# Altium project Audio-Switcher-v1.1.PrjPcb (part 1 of 2)
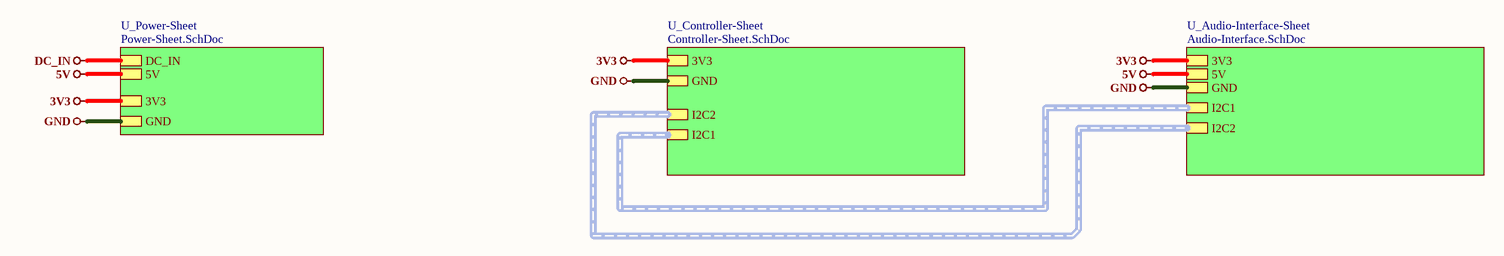
[diagram p0: Top_Sheet.SchDoc]
4 sheets, 134 parts. Net scope: hierarchical (ports join the sheet entries above them; power ports are global).
Board file: Audio-Switcher-v1.1.PcbDoc
Sheets:
  Top_Sheet.SchDoc
    U_Controller-Sheet = Controller-Sheet.SchDoc
    U_Power-Sheet = Power-Sheet.SchDoc
    U_Audio-Interface-Sheet = Audio-Interface.SchDoc

## Sheet Top_Sheet.SchDoc
size 420 x 297 mm; SheetNumber: 1; SheetTotal: 4

### Sub-sheets
U_Audio-Interface-Sheet = Audio-Interface.SchDoc: I2C1 (harness I2C), 3V3, GND, 5V, I2C2 (harness I2C)
U_Controller-Sheet = Controller-Sheet.SchDoc: 3V3, GND, I2C1 (harness I2C), I2C2 (harness I2C)
U_Power-Sheet = Power-Sheet.SchDoc: 3V3, 5V, GND, DC_IN

### Nets
3V3: sheet U_Controller-Sheet/3V3, sheet U_Power-Sheet/3V3, sheet U_Audio-Interface-Sheet/3V3
5V: sheet U_Power-Sheet/5V, sheet U_Audio-Interface-Sheet/5V
GND: sheet U_Controller-Sheet/GND, sheet U_Power-Sheet/GND, sheet U_Audio-Interface-Sheet/GND

### Buses and harness runs
harness sheet U_Audio-Interface-Sheet/I2C1 = sheet U_Controller-Sheet/I2C1
harness sheet U_Audio-Interface-Sheet/I2C2 = sheet U_Controller-Sheet/I2C2

### Notes on the sheet
- File:
- Title:
- Date:
- Page
- Num:
- Total:
- Drawn By: Huzaifa Ali

## Sheet Controller-Sheet.SchDoc
size 420 x 297 mm; SheetNumber: 3; SheetTotal: 4
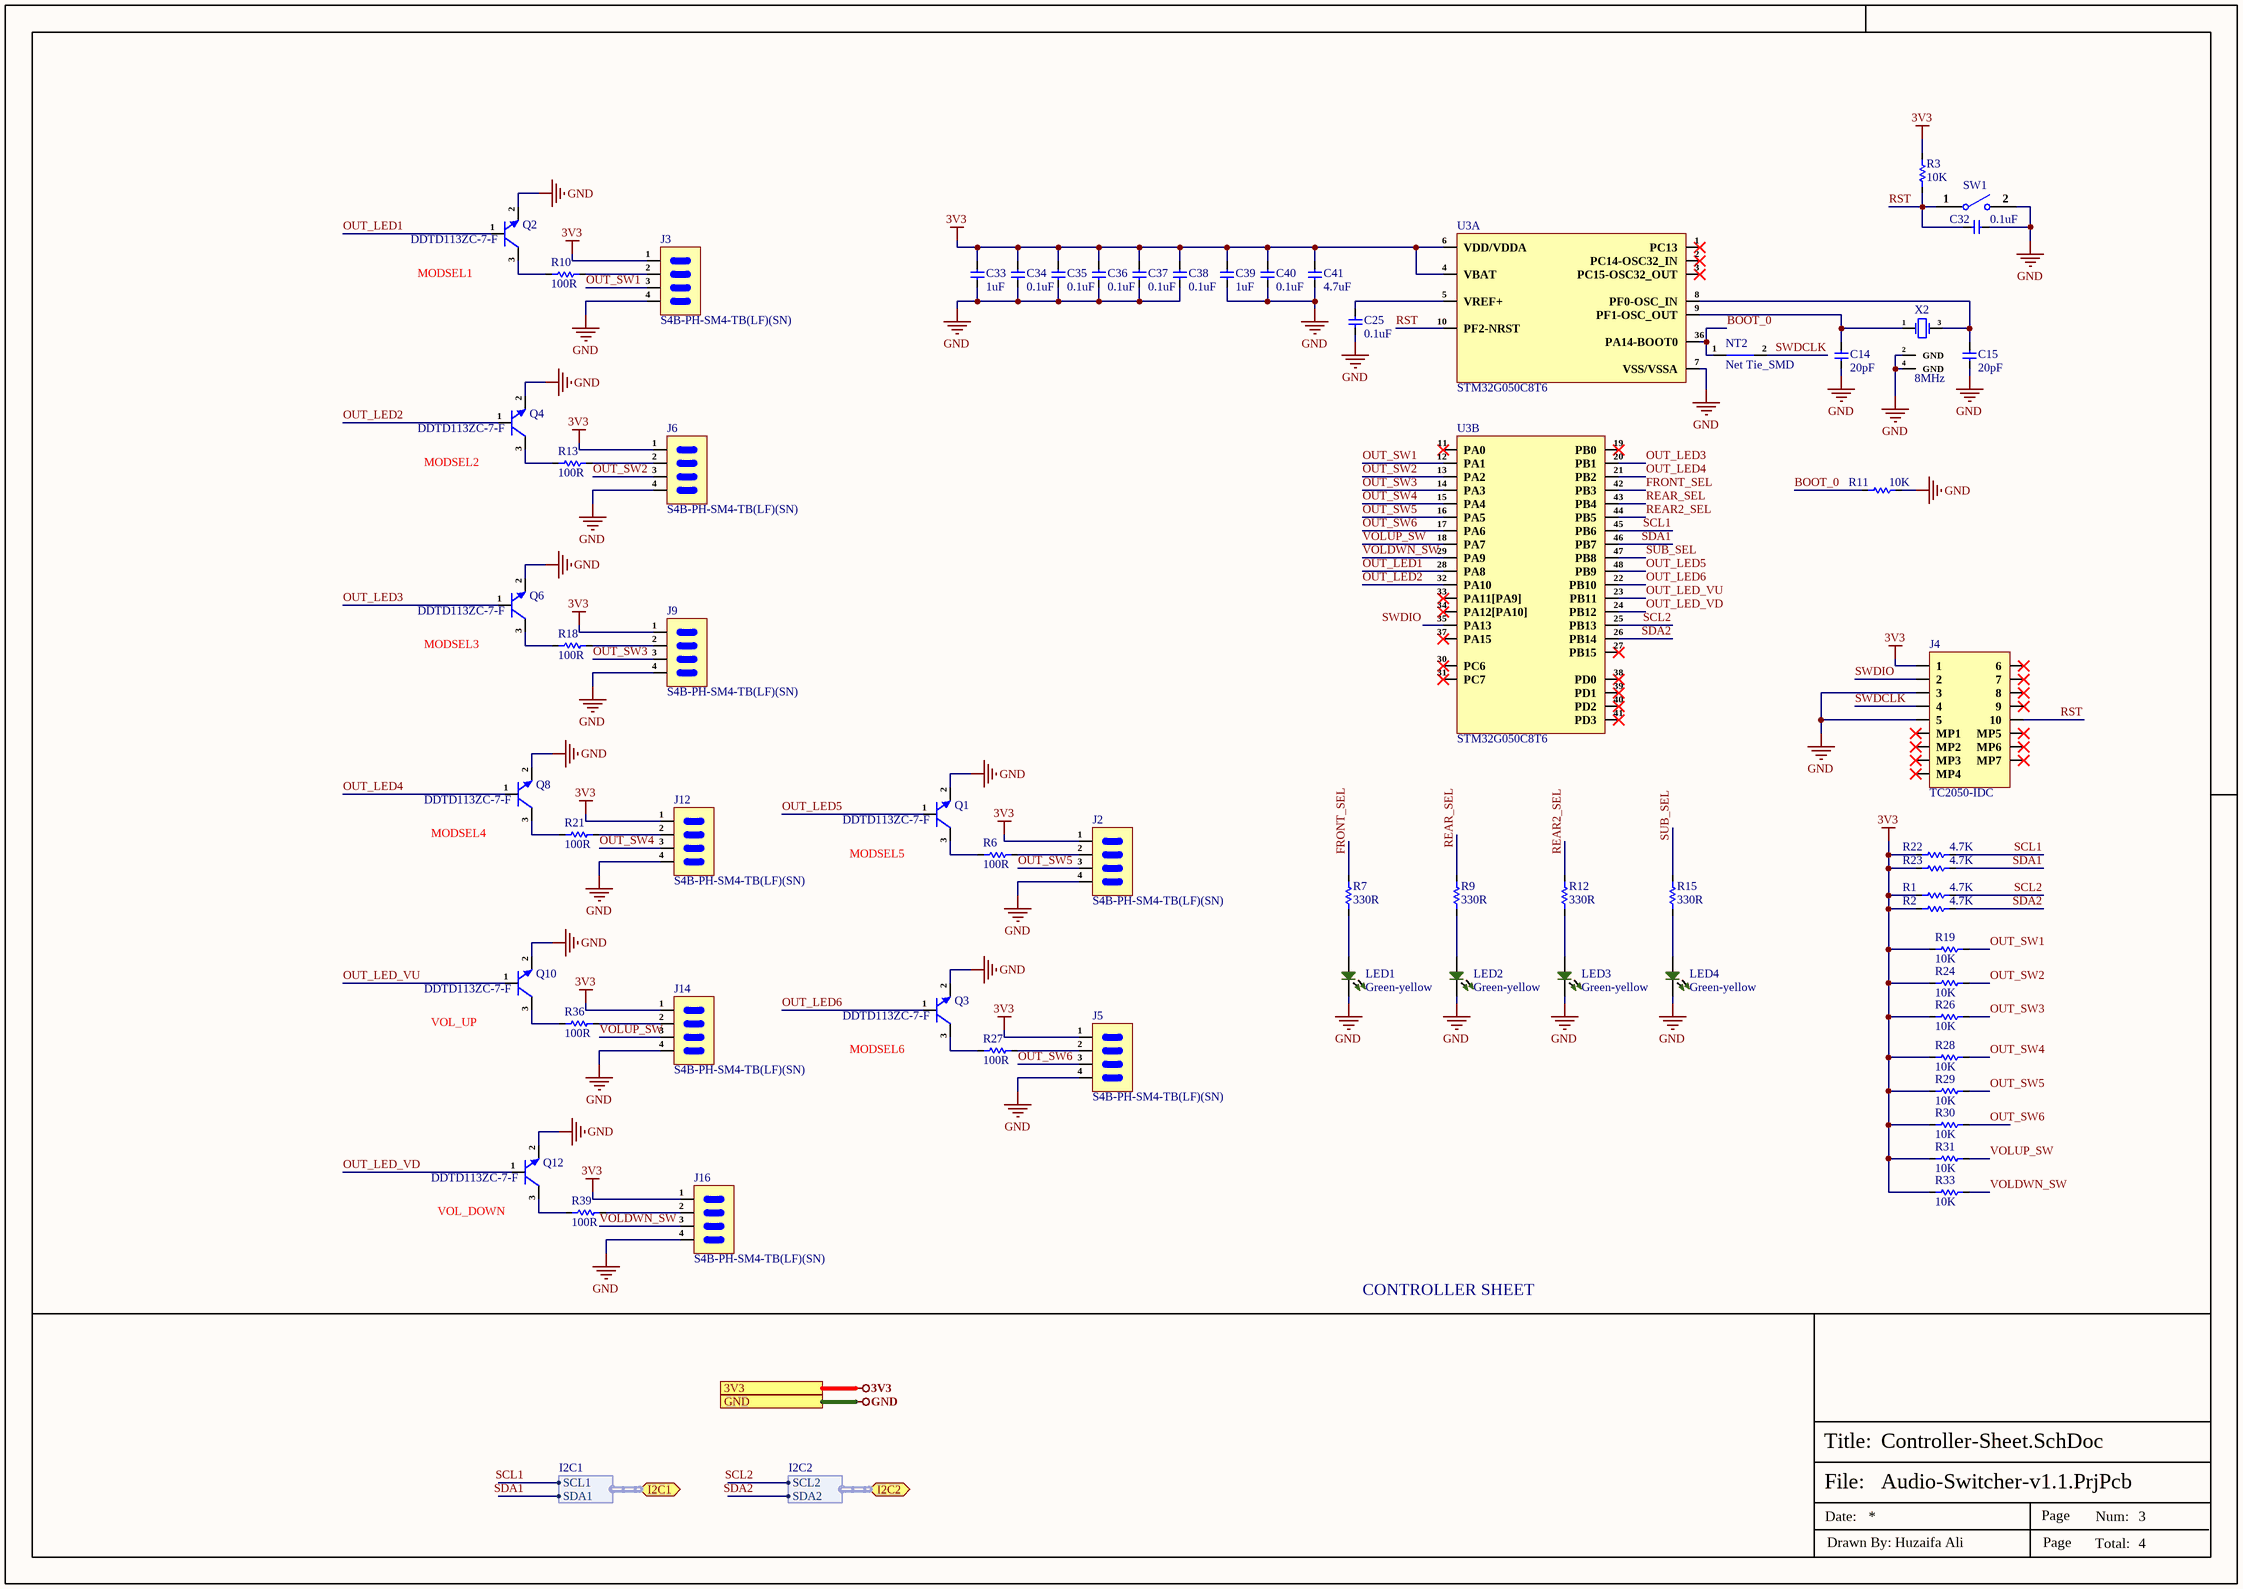
[diagram p1: Controller-Sheet.SchDoc]

### Parts
C14  20pF  [Cap-0402]
C15  20pF  [Cap-0402]
C25  0.1uF  [Cap-0402]
C32  0.1uF  [Cap-0402]
C33  1uF  [Cap-0402]
C34  0.1uF  [Cap-0402]
C35  0.1uF  [Cap-0402]
C36  0.1uF  [Cap-0402]
C37  0.1uF  [Cap-0402]
C38  0.1uF  [Cap-0402]
C39  1uF  [Cap-0402]
C40  0.1uF  [Cap-0402]
C41  4.7uF  [Cap-0402]
J2  S4B-PH-SM4-TB(LF)(SN)  [S4B-PH-SM4-TB(LF)(SN)]
J3  S4B-PH-SM4-TB(LF)(SN)  [S4B-PH-SM4-TB(LF)(SN)]
J4  TC2050-IDC  [TC2050-IDC_]
J5  S4B-PH-SM4-TB(LF)(SN)  [S4B-PH-SM4-TB(LF)(SN)]
J6  S4B-PH-SM4-TB(LF)(SN)  [S4B-PH-SM4-TB(LF)(SN)]
J9  S4B-PH-SM4-TB(LF)(SN)  [S4B-PH-SM4-TB(LF)(SN)]
J12  S4B-PH-SM4-TB(LF)(SN)  [S4B-PH-SM4-TB(LF)(SN)]
J14  S4B-PH-SM4-TB(LF)(SN)  [S4B-PH-SM4-TB(LF)(SN)]
J16  S4B-PH-SM4-TB(LF)(SN)  [S4B-PH-SM4-TB(LF)(SN)]
LED1  Green-yellow  [TH LED Green 3MM]
LED2  Green-yellow  [TH LED Green 3MM]
LED3  Green-yellow  [TH LED Green 3MM]
LED4  Green-yellow  [TH LED Green 3MM]
NT2  Net Tie_SMD  [Net Tie Pad]  (net tie, no BOM)
Q1  DDTD113ZC-7-F  [SOT-23]
Q2  DDTD113ZC-7-F  [SOT-23]
Q3  DDTD113ZC-7-F  [SOT-23]
Q4  DDTD113ZC-7-F  [SOT-23]
Q6  DDTD113ZC-7-F  [SOT-23]
Q8  DDTD113ZC-7-F  [SOT-23]
Q10  DDTD113ZC-7-F  [SOT-23]
Q12  DDTD113ZC-7-F  [SOT-23]
R1  4.7K  [Res-0402]
R2  4.7K  [Res-0402]
R3  10K  [Res-0402]
R6  100R  [Res-0603]
R7  330R  [Res-0201]
R9  330R  [Res-0201]
R10  100R  [Res-0603]
R11  10K  [Res-0402]
R12  330R  [Res-0201]
R13  100R  [Res-0603]
R15  330R  [Res-0201]
R18  100R  [Res-0603]
R19  10K  [Res-0402]
R21  100R  [Res-0603]
R22  4.7K  [Res-0402]
R23  4.7K  [Res-0402]
R24  10K  [Res-0402]
R26  10K  [Res-0402]
R27  100R  [Res-0603]
R28  10K  [Res-0402]
R29  10K  [Res-0402]
R30  10K  [Res-0402]
R31  10K  [Res-0402]
R33  10K  [Res-0402]
R36  100R  [Res-0603]
R39  100R  [Res-0603]
SW1  B3U-1000P  [B3U-1000P]  (value not drawn)
U3  STM32G050C8T6  [48-LQFP (7x7)_]  (parts A,B of 2)
X2  8MHz  [5TJ480000XYLBC_]

### Ports
3V3 (see Top_Sheet[3A], Audio-Interface[5D], Power-Sheet[4D]), GND (see Top_Sheet[3B], Audio-Interface[5D], Power-Sheet[4D]), I2C1 (bidir, harness I2C1, see Top_Sheet[3B], Audio-Interface[2D]), I2C2 (bidir, harness I2C2, see Top_Sheet[3B], Audio-Interface[2D])

### Harnesses
I2C1: SCL1, SDA1
I2C2: SCL2, SDA2

### Nets
3V3: C33.2 C34.2 C35.2 C36.2 C37.2 C38.2 C39.2 C40.2 C41.2 J2.1 J3.1 J4.1 J5.1 J6.1 J9.1 J12.1 J14.1 J16.1 R1.1 R2.1 R3.1 R19.1 R22.1 R23.1 R24.1 R26.1 R28.1 R29.1 R30.1 R31.1 R33.1 U3.4(VBAT) U3.6(VDD/VDDA) ; port 3V3
GND: C14.1 C15.1 C25.1 C32.1 C33.1 C34.1 C35.1 C36.1 C37.1 C38.1 C39.1 C40.1 C41.1 J2.4 J3.4 J4.3 J4.5 J5.4 J6.4 J9.4 J12.4 J14.4 J16.4 LED1.2 LED2.2 LED3.2 LED4.2 Q1.2(E) Q2.2(E) Q3.2(E) Q4.2(E) Q6.2(E) Q8.2(E) Q10.2(E) Q12.2(E) R11.1 SW1.2 U3.7(VSS/VSSA) X2.2(GND) X2.4(GND) ; port GND
BOOT_0: NT2.1 R11.2 U3.36(PA14-BOOT0)
FRONT_SEL: R7.2 U3.42(PB3)
OUT_LED1: Q2.1(B) U3.28(PA8)
OUT_LED2: Q4.1(B) U3.32(PA10)
OUT_LED3: Q6.1(B) U3.20(PB1)
OUT_LED4: Q8.1(B) U3.21(PB2)
OUT_LED5: Q1.1(B) U3.48(PB9)
OUT_LED6: Q3.1(B) U3.22(PB10)
OUT_LED_VD: Q12.1(B) U3.24(PB12)
OUT_LED_VU: Q10.1(B) U3.23(PB11)
OUT_SW1: J3.3 R19.2 U3.12(PA1)
OUT_SW2: J6.3 R24.2 U3.13(PA2)
OUT_SW3: J9.3 R26.2 U3.14(PA3)
OUT_SW4: J12.3 R28.2 U3.15(PA4)
OUT_SW5: J2.3 R29.2 U3.16(PA5)
OUT_SW6: J5.3 R30.2 U3.17(PA6)
REAR2_SEL: R12.2 U3.44(PB5)
REAR_SEL: R9.2 U3.43(PB4)
RST: C32.2 J4.10 R3.2 SW1.1 U3.10(PF2-NRST)
SCL1: R22.2 U3.45(PB6) ; port I2C1.SCL1
SCL2: R1.2 U3.25(PB13) ; port I2C2.SCL2
SDA1: R23.2 U3.46(PB7) ; port I2C1.SDA1
SDA2: R2.2 U3.26(PB14) ; port I2C2.SDA2
SUB_SEL: R15.2 U3.47(PB8)
SWDCLK: J4.4 NT2.2
SWDIO: J4.2 U3.35(PA13)
VOLDWN_SW: J16.3 R33.2 U3.29(PA9)
VOLUP_SW: J14.3 R31.2 U3.18(PA7)
NetC14_2: C14.2 U3.9(PF1-OSC_OUT) X2.1(OSC1)
NetC15_2: C15.2 U3.8(PF0-OSC_IN) X2.3(OSC2)
NetC25_2: C25.2 U3.5(VREF+)
NetJ2_2: J2.2 R6.2
NetJ3_2: J3.2 R10.2
NetJ5_2: J5.2 R27.2
NetJ6_2: J6.2 R13.2
NetJ9_2: J9.2 R18.2
NetJ12_2: J12.2 R21.2
NetJ14_2: J14.2 R36.2
NetJ16_2: J16.2 R39.2
NetLED1_1: LED1.1 R7.1
NetLED2_1: LED2.1 R9.1
NetLED3_1: LED3.1 R12.1
NetLED4_1: LED4.1 R15.1
NetQ1_3: Q1.3(C) R6.1
NetQ2_3: Q2.3(C) R10.1
NetQ3_3: Q3.3(C) R27.1
NetQ4_3: Q4.3(C) R13.1
NetQ6_3: Q6.3(C) R18.1
NetQ8_3: Q8.3(C) R21.1
NetQ10_3: Q10.3(C) R36.1
NetQ12_3: Q12.3(C) R39.1

Not connected (* = marked no-connect by the designer): J4 6* 7* 8* 9* MP1* MP2* MP3* MP4* MP5* MP6* MP7*; U3 1(PC13)* 2(PC14-OSC32_IN)* 3(PC15-OSC32_OUT)* 11(PA0)* 19(PB0)* 27(PB15)* 30(PC6)* 31(PC7)* 33(PA11[PA9])* 34(PA12[PA10])* 37(PA15)* 38(PD0)* 39(PD1)* 40(PD2)* 41(PD3)*

### Notes on the sheet
- (near Q2) MODSEL1
- (near Q4) MODSEL2
- (near Q6) MODSEL3
- (near Q8) MODSEL4
- (near Q1) MODSEL5
- VOL_UP
- (near Q3) MODSEL6
- (near Q12) VOL_DOWN
- CONTROLLER SHEET
- File:
- Title:
- Date:
- Page
- Num:
- Total:
- Drawn By: Huzaifa Ali

### Library data of the parts
C14 C15 = CC0402JRNPO9BN200: CAP CER 20PF 50V C0G/NPO 0402; Manufacturer: Yageo; Item Type: Capacitor; Temperature Coefficient: 30ppm/°C; Supplier: Avnet; LCSC Part Number: C107000; Manufacturer Part Number: CC0402JRNPO9BN200; RoHS: Yes; Stock: 20000; Pricing: 10000=0.00221 (USD); Halogen Free: 5694HalogenFree; ComponentLink1URL: https://datasheet.ciiva.com/176/mlccorderingcode-176360.pdf?src-supplier=Digikey; ComponentLink1Description: https://datasheet.ciiva.com/176/mlccorderingcode-176360.pdf?src-supplier=Digikey; ComponentLink2URL: https://datasheet.ciiva.com/176/mlccorderingcode-176361.pdf?src-supplier=Digikey; ComponentLink2Description: https://datasheet.ciiva.com/176/mlccorderingcode-176361.pdf?src-supplier=Digikey; ComponentLink3URL: https://datasheet.ciiva.com/176/mlccorderingcode-176362.pdf?src-supplier=Digikey; ComponentLink3Description: https://datasheet.ciiva.com/176/mlccorderingcode-176362.pdf?src-supplier=Digikey; ComponentLink4URL: https://datasheet.ciiva.com/7656/1132289-7656614.pdf?src-supplier=Element14; ComponentLink4Description: https://datasheet.ciiva.com/7656/1132289-7656614.pdf?src-supplier=Element14; ComponentLink5URL: https://datasheet.ciiva.com/5427/upy-gp-np0-16v-to-50v-8-3714-5427769.pdf?src-supplier=Mouser; ComponentLink5Description: https://datasheet.ciiva.com/5427/upy-gp-np0-16v-to-50v-8-3714-5427769.pdf?src-supplier=Mouser
C25 C32 C34-C38 C40 = CC0402KRX7R8BB104: CAP CER 0.1UF 25V X7R 0402; Manufacturer: Yageo; Tolerance: 10%; Capacitance: 100nF; Dissipation Factor: 3.5%; Supplier 1: Digi-Key; Manufacturer Part Number: CC0402KRX7R8BB104; RoHS: Yes; Category: Ceramic Capacitors; Stock 1: 1841009; Pricing 1: 1=0.10000, 10=0.03100, 50=0.01700, 100=0.01390, 500=0.00990, 1000=0.00777, 2500=0.00707, 5000=0.00650 (USD); Mount: Surface Mount; Case/Package: 0402; Case Code (Imperial): 0402; Case Code (Metric): 1005; Min Operating Temperature: -55°C; Max Operating Temperature: 125°C; Dielectric: X7R; Voltage Rating: 25V; Voltage Rating (DC): 25V; Packaging: Tape and Reel; Termination: SMD/SMT; Resistor Type: Ceramic; Length: 1mm; Width: 0.02inch; Height: 0.5mm; Thickness: 0.022inch; Depth: 0.5mm; Radiation Hardening: No; Lead Free: Lead Free; Halogen Free: Halogen Free; ComponentLink1URL: https://datasheet.ciiva.com/11464/upy-gphc-x7r-6-3v-to-50v-8-11464889.pdf?src-supplier=Avnet; ComponentLink1Description: https://datasheet.ciiva.com/11464/upy-gphc-x7r-6-3v-to-50v-8-11464889.pdf?src-supplier=Avnet; ComponentLink2URL: https://datasheet.ciiva.com/13210/upy-gphc-x7r-6-3v-to-50v-8-12304-13210908.pdf?src-supplier=Mouser; ComponentLink2Description: https://datasheet.ciiva.com/13210/upy-gphc-x7r-6-3v-to-50v-8-12304-13210908.pdf?src-supplier=Mouser; ComponentLink3URL: https://datasheet.ciiva.com/17437/upy-gphc-x7r-6-3v-to-50v-8-17437357.pdf?src-supplier=Avnet+Europe; ComponentLink3Description: https://datasheet.ciiva.com/17437/upy-gphc-x7r-6-3v-to-50v-8-17437357.pdf?src-supplier=Avnet+Europe; Supplier Part Number 1: 311-2077-1-ND; LCSC Part Number: C105883
C33 C39 = CC0402KRX5R7BB105: CAP CER 1UF 16V X5R 0402; Manufacturer: Yageo; Tolerance: 10%; Item Type: Capacitor; Supplier 1: Digi-Key; Manufacturer Part Number: CC0402KRX5R7BB105; Stock 1: 1405667; Pricing 1: 1=0.36, 10=0.252, 100=0.1512, 500=0.1134, 1000=0.09576, 2500=0.09072, 5000=0.08568 (USD); Mount: Surface Mount; Case/Package: 0402; Weight: 2.3E-05oz; Case Code (Imperial): 0402; Case Code (Metric): 1005; Min Operating Temperature: -55°C; Max Operating Temperature: 85°C; Capacitance: 1uF; Dielectric: X5R; Packaging: Tape and Reel; Voltage Rating (DC): 16V; Voltage Rating: 16V; Termination: SMD/SMT; Composition: Ceramic; Length: 1mm; Height: 0.5mm; Width: 0.02inch; Thickness: 0.022inch; Depth: 0.5mm; Radiation Hardening: No; Lead Free: Lead Free; Halogen Free: Halogen Free; ComponentLink1URL: http://www.yageo.com/documents/recent/UPY-GPHC_X5R_4V-to-50V_12.pdf?src-supplier=Avnet+Europe; ComponentLink1Description: http://www.yageo.com/documents/recent/UPY-GPHC_X5R_4V-to-50V_12.pdf?src-supplier=Avnet+Europe; Supplier Part Number 1: 311-1691-6-ND; LCSC Part Number: C325464
C41 = CL05A475MO5NUNC: CAP CER 4.7UF 16V X5R 0402; Manufacturer: Samsung; Material: 4241ConductorMaterial; Tolerance: 20%; Supplier 1: Avnet; Manufacturer Part Number: CL05A475MO5NUNC; RoHS: Yes; Category: Ceramic Capacitors; Stock 1: 50000; Pricing 1: 10000=0.09712 (USD); Mount: Surface Mount; Case/Package: 0402; Case Code (Metric): 1005; Case Code (Imperial): 0402; Min Operating Temperature: -55°C; Max Operating Temperature: 85°C; Packaging: Cut Tape; Capacitance: 4.7uF; Voltage Rating: 16V; Series: CL; Voltage Rating (DC): 16V; Length: 0.039inch; Width: 0.02inch; Height: 550um; Thickness: 0.022inch; RoHS Compliant: Yes; ComponentLink1URL: http://www.farnell.com/datasheets/2710653.pdf?src-supplier=Farnell; ComponentLink1Description: http://www.farnell.com/datasheets/2710653.pdf?src-supplier=Farnell; ComponentLink2URL: http://www.samsungsem.com/kr/support/product-search/mlcc/CL05A475MO5NUNC.jsp?src-supplier=Digikey; ComponentLink2Description: http://www.samsungsem.com/kr/support/product-search/mlcc/CL05A475MO5NUNC.jsp?src-supplier=Digikey; ComponentLink3URL: http://www.farnell.com/datasheets/2710653.pdf?src-supplier=Element14; ComponentLink3Description: http://www.farnell.com/datasheets/2710653.pdf?src-supplier=Element14; ComponentLink4URL: https://datasheet.octopart.com/CL05A475MO5NUNC-Samsung-Electro-Mechanics-datasheet-123102911.pdf?src-supplier=Future+Electronics; ComponentLink4Description: https://datasheet.octopart.com/CL05A475MO5NUNC-Samsung-Electro-Mechanics-datasheet-123102911.pdf?src-supplier=Future+Electronics; ComponentLink5URL: http://www.farnell.com/datasheets/2710653.pdf?src-supplier=Newark; ComponentLink5Description: http://www.farnell.com/datasheets/2710653.pdf?src-supplier=Newark; Supplier Part Number 1: CL05A475MO5NUNC
J2 J3 J5 J6 J9 J12 J14 J16 = S4B-PH-SM4-TB(LF)(SN): CONN HEADER SMD R/A 4POS 2MM; Manufacturer: JST; Item Type: Connectors; Gender: 29Gender; Supplier: Future Electronics; Supplier Part Number: 7687031; Manufacturer Part Number: S4B-PH-SM4-TB(LF)(SN); RoHS: Yes; Stock: 78; Pricing: 1=0.935, 10=0.83, 40=0.77, 150=0.71, 500=0.655 (USD); ComponentLink1URL: https://datasheet.ciiva.com/11746/0900766b80df0d9d-11746552.pdf?src-supplier=Rs; ComponentLink1Description: https://datasheet.ciiva.com/11746/0900766b80df0d9d-11746552.pdf?src-supplier=Rs; ComponentLink2URL: https://datasheet.ciiva.com/712/eph-712578.pdf?src-supplier=Digikey; ComponentLink2Description: https://datasheet.ciiva.com/712/eph-712578.pdf?src-supplier=Digikey; ComponentLink3URL: https://datasheet.ciiva.com/712/eph-712579.pdf?src-supplier=Digikey; ComponentLink3Description: https://datasheet.ciiva.com/712/eph-712579.pdf?src-supplier=Digikey; ComponentLink4URL: https://datasheet.ciiva.com/730/eph-730675.pdf?src-supplier=Digikey; ComponentLink4Description: https://datasheet.ciiva.com/730/eph-730675.pdf?src-supplier=Digikey; ComponentLink5URL: https://datasheet.ciiva.com/8052/1699381-8052234.pdf?src-supplier=Element14; ComponentLink5Description: https://datasheet.ciiva.com/8052/1699381-8052234.pdf?src-supplier=Element14; LCSC Part Number: C265102
J4 = TC2050-IDC: CBL PLUG-OF-NAILS 10-PIN W/LEGS; Manufacturer: Tag-Connect; Supplier 1: Digi-Key; Manufacturer Part Number: TC2050-IDC; Stock 1: 59; Pricing 1: 1=40.17 (USD); Package Quantity: 1; ComponentLink1URL: http://www.tag-connect.com/Materials/TC2050-IDC%20Datasheet.pdf?src-supplier=Digi-Key; ComponentLink1Description: http://www.tag-connect.com/Materials/TC2050-IDC%20Datasheet.pdf?src-supplier=Digi-Key; Supplier Part Number 1: TC2050-IDC-ND
LED1-LED4 = 204-10SYGD/S530-E3: LED Single Standard Yellow Green 573nm 25mA 2-Pin T-1 Bag; Manufacturer: Everlight; Viewing Angle: 45°; Luminous Intensity: 100mcd; Forward Voltage: 2.4V; Lens Style: Diffused,Colored; Power Dissipation: 60W; Number of Elements: 1; Reverse Voltage: 5V; Supplier: Digikey; Supplier Part Number: 1080-204-10SYGD/S530-E3TR-ND; Manufacturer Part Number: 204-10SYGD/S530-E3; RoHS: Yes; Pricing: 3000=0.10482, 5000=0.09847, 10000=0.09212, 25000=0.08449, 50000=0.08132, 100000=0.07941 (USD); Mounting Technology: Through Hole; Case/Package: T; Pins: 2; Min Operating Temperature: -40°C; Max Operating Temperature: 85°C; Forward Current: 25mA; Packaging: Tape and Reel; Dominant Wavelength: 573nm; Wavelength: 573nm; Length: 4mm; Depth: 4mm; Radiation Hardening: No; RoHS Compliant: Yes; ComponentLink1URL: https://datasheet.ciiva.com/26901/getdatasheetpartid-707371-26901329.pdf?src-supplier=Verical; ComponentLink1Description: https://datasheet.ciiva.com/26901/getdatasheetpartid-707371-26901329.pdf?src-supplier=Verical; LCSC Part Number: C85161; Item Type: LED
NT2 = Net Tie_SMD: Net Tie SMD; Manufacturer Part Number: Net Tie; Item Type: Net Tie Pad
Q1-Q4 Q6 Q8 Q10 Q12 = DDTD113ZC-7-F: TRANS PREBIAS NPN 50V SOT23-3; Manufacturer: Diodes Zetex; Item Type: BJTs; Supplier: Digikey; Supplier Part Number: DDTD113ZC-7FDICT-ND; Manufacturer Part Number: DDTD113ZC-7-F; RoHS: Yes; Stock: 793860; Pricing: 1=0.31, 10=0.21, 100=0.1027, 500=0.08562, 1000=0.05949 (USD); ComponentLink1URL: https://datasheet.ciiva.com/15139/getdatasheetpartid-323116-15139824.pdf?src-supplier=Verical; ComponentLink1Description: https://datasheet.ciiva.com/15139/getdatasheetpartid-323116-15139824.pdf?src-supplier=Verical
R1 R2 R22 R23 = RC0402FR-074K7L: RES 4.7K OHM 1% 1/16W 0402; Manufacturer: Yageo; Voltage Rating (DC): 50V; Power Rating: 62.5mW; Resistance: 4.7kR; Temperature Coefficient: 100ppm/°C; Max Power Dissipation: 63mW; Item Type: Resistor; Supplier 1: Avnet; Manufacturer Part Number: RC0402FR-074K7L; RoHS: Yes; Category: Chip SMD Resistors; Stock 1: 2420000; Pricing 1: 10000=0.00085 (USD); Case/Package: 0402; Number of Pins: 2; Case Code (Imperial): 0402; Case Code (Metric): 1005; Size Code: 0402; Min Operating Temperature: -55°C; Max Operating Temperature: 155°C; Tolerance: 1%; Voltage Rating: 50V; Packaging: Tape and Reel; Resistor Type: Thick Film; Termination: SMD/SMT; Features: Moisture Resistant; Series: RC; Number of Terminations: 2; Resistance Tolerance: 1%; Construction: Rectangular; Length: 1mm; Width: 0.5mm; Height: 0.32mm; Depth: 0.5mm; Height - Seated (Max): 0.016inch; RoHS Compliant: Yes; Reach SVHC Compliant: Yes; Military Standard: Not; Lead Free: Lead Free; ComponentLink1URL: https://datasheet.ciiva.com/22661/1686128-22661342.pdf?src-supplier=Element14; ComponentLink1Description: https://datasheet.ciiva.com/22661/1686128-22661342.pdf?src-supplier=Element14; ComponentLink2URL: https://datasheet.ciiva.com/7850/1018594-7850022.pdf?src-supplier=Element14; ComponentLink2Description: https://datasheet.ciiva.com/7850/1018594-7850022.pdf?src-supplier=Element14; ComponentLink3URL: https://datasheet.ciiva.com/7850/1018594-7850023.pdf?src-supplier=Element14; ComponentLink3Description: https://datasheet.ciiva.com/7850/1018594-7850023.pdf?src-supplier=Element14; ComponentLink4URL: https://datasheet.ciiva.com/15215/getdatasheetpartid-328119-15215035.pdf?src-supplier=Verical; ComponentLink4Description: https://datasheet.ciiva.com/15215/getdatasheetpartid-328119-15215035.pdf?src-supplier=Verical; Supplier Part Number 1: RC0402FR-074K7L; LCSC Part Number: C105871
R3 R11 R19 R24 R26 R28-R31 R33 = RC0402FR-0710KL: RES 10K OHM 1% 1/16W 0402; Manufacturer: Yageo; Resistance: 10kR; Voltage Rating (DC): 50V; Temperature Coefficient: 100ppm/°C; Power Rating: 62.5mW; Max Power Dissipation: 63mW; Item Type: Resistor; Supplier 1: Mouser; Manufacturer Part Number: RC0402FR-0710KL; RoHS: Yes; Category: Chip SMD Resistors; Stock 1: 18648329; Pricing 1: 1=0.10000, 10=0.01400, 50=0.01400, 100=0.00500, 1000=0.00300, 10000=0.00200 (USD); Case/Package: 0402; Number of Pins: 2; Case Code (Imperial): 0402; Case Code (Metric): 1005; Min Operating Temperature: -55°C; Max Operating Temperature: 155°C; Resistor Type: Thick Film; Tolerance: 1%; Packaging: Tape and Reel; Voltage Rating: 50V; Termination: SMD/SMT; Working Voltage: 50V; Number of Terminations: 2; Features: Moisture Resistant; Series: RC; Resistance Tolerance: 1%; Construction: Rectangular; Length: 1mm; Width: 0.5mm; Height: 0.32mm; Depth: 0.5mm; Lead Pitch: 0.2mm; REACH SVHC: No SVHC; Lead Free: Lead Free; RoHS Compliant: Yes; Military Standard: Not; ComponentLink1URL: https://datasheet.ciiva.com/7660/38568-7660787.pdf?src-supplier=Element14; ComponentLink1Description: https://datasheet.ciiva.com/7660/38568-7660787.pdf?src-supplier=Element14; ComponentLink2URL: https://datasheet.ciiva.com/7849/1686128-7849814.pdf?src-supplier=Element14; ComponentLink2Description: https://datasheet.ciiva.com/7849/1686128-7849814.pdf?src-supplier=Element14; ComponentLink3URL: https://datasheet.ciiva.com/7983/1018594-7983486.pdf?src-supplier=Element14; ComponentLink3Description: https://datasheet.ciiva.com/7983/1018594-7983486.pdf?src-supplier=Element14; ComponentLink4URL: https://datasheet.ciiva.com/22747/1018594-22747512.pdf?src-supplier=Element14; ComponentLink4Description: https://datasheet.ciiva.com/22747/1018594-22747512.pdf?src-supplier=Element14; ComponentLink5URL: https://datasheet.ciiva.com/12667/pyu-rc0402-51-rohs-l-6-r-12667067.pdf?src-supplier=Mouser; ComponentLink5Description: https://datasheet.ciiva.com/12667/pyu-rc0402-51-rohs-l-6-r-12667067.pdf?src-supplier=Mouser; ComponentLink6URL: https://datasheet.ciiva.com/7849/1784430-7849813.pdf?src-supplier=Element14; ComponentLink6Description: https://datasheet.ciiva.com/7849/1784430-7849813.pdf?src-supplier=Element14; ComponentLink7URL: https://datasheet.ciiva.com/7849/1784430-7849815.pdf?src-supplier=Element14; ComponentLink7Description: https://datasheet.ciiva.com/7849/1784430-7849815.pdf?src-supplier=Element14; Supplier Part Number 1: 603-RC0402FR-0710KL; LCSC Part Number: C60490
R6 R10 R13 R18 R21 R27 R36 R39 = RC0603FR-07100RL: RES SMD 100 OHM 1% 1/10W 0603; Manufacturer: Yageo; Temperature Coefficient: 100ppm/°C; Voltage Rating (DC): 50V; Power Rating: 100mW; Item Type: Resistor; Supplier 1: Arrow Electronics; Manufacturer Part Number: RC0603FR-07100RL; RoHS: Yes; Category: Chip SMD Resistors; Stock 1: 3800000; Pricing 1: 5000=0.00300, 5000=0.00200, 5000=0.00450, 50000=0.00410, 500000=0.00230, 2500000=0.00140 (USD); Case/Package: 0603; Number of Pins: 2; Case Code (Imperial): 0603; Case Code (Metric): 1608; Size Code: 0603; Min Operating Temperature: -55°C; Max Operating Temperature: 155°C; Resistance: 100R; Tolerance: 1%; Resistor Type: Thick Film; Packaging: Tape and Reel; Voltage Rating: 50V; Termination: SMD/SMT; Features: Moisture Resistant; Series: RC; Max Power Dissipation: 100mW; Number of Terminations: 2; Construction: Rectangular; Resistance Tolerance: 1%; Technology: THICK FILM; Length: 1.6mm; Width: 0.8mm; Height: 0.45mm; Depth: 0.8mm; REACH SVHC: Unknown; Lead Free: Lead Free; RoHS Compliant: Yes; Military Standard: Not; Supplier Part Number 1: RC0603FR-07100RL; LCSC Part Number: C105588
R7 R9 R12 R15 = RC0201DR-07330RL: RES 330 OHM 0.5% 1/20W 0201; Manufacturer: Yageo; Max Power Dissipation: 50mW; Temperature Coefficient: 200ppm/°C; Item Type: Resistor; Supplier 1: Digi-Key; Manufacturer Part Number: RC0201DR-07330RL; RoHS: Yes; Category: Chip SMD Resistors; Pricing 1: 10000=0.02267 (USD); Case/Package: 0201; Min Operating Temperature: -55°C; Max Operating Temperature: 125°C; Packaging: Tape and Reel; Value: 330R; Number of Terminations: 2; Tolerance: 0.5%; Features: Moisture Resistant; Series: RC; Length: 0.024inch; Width: 0.012inch; Height: 0.01inch; RoHS Compliant: Yes; ComponentLink1URL: http://www.yageo.com.tw/exep/pages/download/literatures/PYu-R_INT-thick_7.pdf?src-supplier=Digi-Key; ComponentLink1Description: http://www.yageo.com.tw/exep/pages/download/literatures/PYu-R_INT-thick_7.pdf?src-supplier=Digi-Key; Supplier Part Number 1: RC0201DR-07330RL-ND; LCSC Part Number: C851717
SW1 = B3U-1000P: SWITCH TACTILE SPST-NO 0.05A 12V; Manufacturer: Omron; Mechanical Life: 200000Cycles; Operating Force: 1.5N; Throw Configuration: SPST; Current Rating: 50mA; Contact Resistance: 100mR; Illumination Type: Non-Illuminated,Illuminated; Switch Travel: 0.15mm; Switch Function: Off-Mom; Actuator Type: Standard; Actuator Length: 0.4mm; Ratings: Dust Proof,IP40; ComponentLink1URL: http://www.farnell.com/datasheets/60838.pdf?src-supplier=Farnell; ComponentLink1Description: http://www.farnell.com/datasheets/60838.pdf?src-supplier=Farnell; ComponentLink2URL: http://www.farnell.com/datasheets/60838.pdf?src-supplier=Element14; ComponentLink2Description: http://www.farnell.com/datasheets/60838.pdf?src-supplier=Element14; ComponentLink3URL: https://omronfs.omron.com/en_US/ecb/products/pdf/en-b3u.pdf?src-supplier=Digi-Key; ComponentLink3Description: https://omronfs.omron.com/en_US/ecb/products/pdf/en-b3u.pdf?src-supplier=Digi-Key; ComponentLink4URL: http://www.omron.com/ecb/products/pdf/en-b3u.pdf?src-supplier=Digi-Key; ComponentLink4Description: http://www.omron.com/ecb/products/pdf/en-b3u.pdf?src-supplier=Digi-Key; ComponentLink5URL: https://www.distrelec.biz/Web/Downloads/he/et/B3U_eng_datasheet.pdf?mime=application%2Fpdf&src-supplier=Distrelec; ComponentLink5Description: https://www.distrelec.biz/Web/Downloads/he/et/B3U_eng_datasheet.pdf?mime=application%2Fpdf&src-supplier=Distrelec; ComponentLink6URL: http://www.onlinecomponents.com/productFiles/mf-OM/en-b3u.pdf?src-supplier=Onlinecomponents.com; ComponentLink6Description: http://www.onlinecomponents.com/productFiles/mf-OM/en-b3u.pdf?src-supplier=Onlinecomponents.com; Supplier 1: Digi-Key; Manufacturer Part Number: B3U-1000P; Stock 1: 116454; Pricing 1: 1=1, 10=0.961, 25=0.9064, 50=0.7976, 100=0.7251, 250=0.68888, 500=0.67074, 1000=0.52571 (USD); Mount: Surface Mount; Weight: 0.000776oz; Contact Material: Silver; Min Operating Temperature: -25°C; Max Operating Temperature: 70°C; Packaging: Tape and Reel; Voltage Rating (DC): 12V; Package Quantity: 1; Max Current Rating: 50mA; Termination: SMD/SMT; Orientation: Straight; Max Voltage Rating (DC): 12V; Electrical Life: 200000Cycles; Insulation Resistance: 100MR; Contact Current Rating: 50mA; Length: 4mm; Height: 1.2mm; Depth: 2.5mm; Width: 3mm; REACH SVHC: Unknown; Lead Free: Lead Free; ComponentLink7URL: https://www.verical.com/server-webapp/html/getDatasheet?partID=552554&src-supplier=Verical; ComponentLink7Description: https://www.verical.com/server-webapp/html/getDatasheet?partID=552554&src-supplier=Verical; ComponentLink8URL: http://www.farnell.com/datasheets/1685550.pdf?src-supplier=Element14; ComponentLink8Description: http://www.farnell.com/datasheets/1685550.pdf?src-supplier=Element14; ComponentLink9URL: http://www.farnell.com/datasheets/2610940.pdf?src-supplier=Farnell; ComponentLink9Description: http://www.farnell.com/datasheets/2610940.pdf?src-supplier=Farnell; ComponentLink10URL: https://www.alliedelec.com/m/d/4c8a9ef82804fc3c241a13c1e298fd73.pdf?src-supplier=Allied+Electronics; ComponentLink10Description: https://www.alliedelec.com/m/d/4c8a9ef82804fc3c241a13c1e298fd73.pdf?src-supplier=Allied+Electronics; Supplier Part Number 1: SW1020DKR-ND; LCSC Part Number: C231329; Item Type: Switch
U3 = STM32G050C8T6: IC MCU 32BIT 64KB FLASH 48LQFP; Manufacturer: STMicroelectronics; Supplier: Mouser; LCSC Part Number: C3227086; Manufacturer Part Number: STM32G050C8T6; RoHS: Yes; Item Type: IC; Stock: 2733; Pricing: 1=2.3, 10=1.75, 50=1.75, 100=1.67, 1000=1.12, 10000=1.04 (USD)
X2 = 5TJ480000XYLBC: 8MHz 18pF ±10ppm SMD5032-4P Crystals ROHS; Manufacturer: JYJE; Manufacturer Part Number: 5TJ480000XYLBC; ComponentLink1Description: LCSC; ComponentLink1URL: https://www.lcsc.com/product-detail/Crystals_JYJE-5TJ480000XYLBC_C2149247.html; Package: SMD5032-4P; LCSC Part Number: C2149247; Item Type: Crystal

## Sheet Power-Sheet.SchDoc
size 420 x 297 mm; SheetNumber: 2; SheetTotal: 4
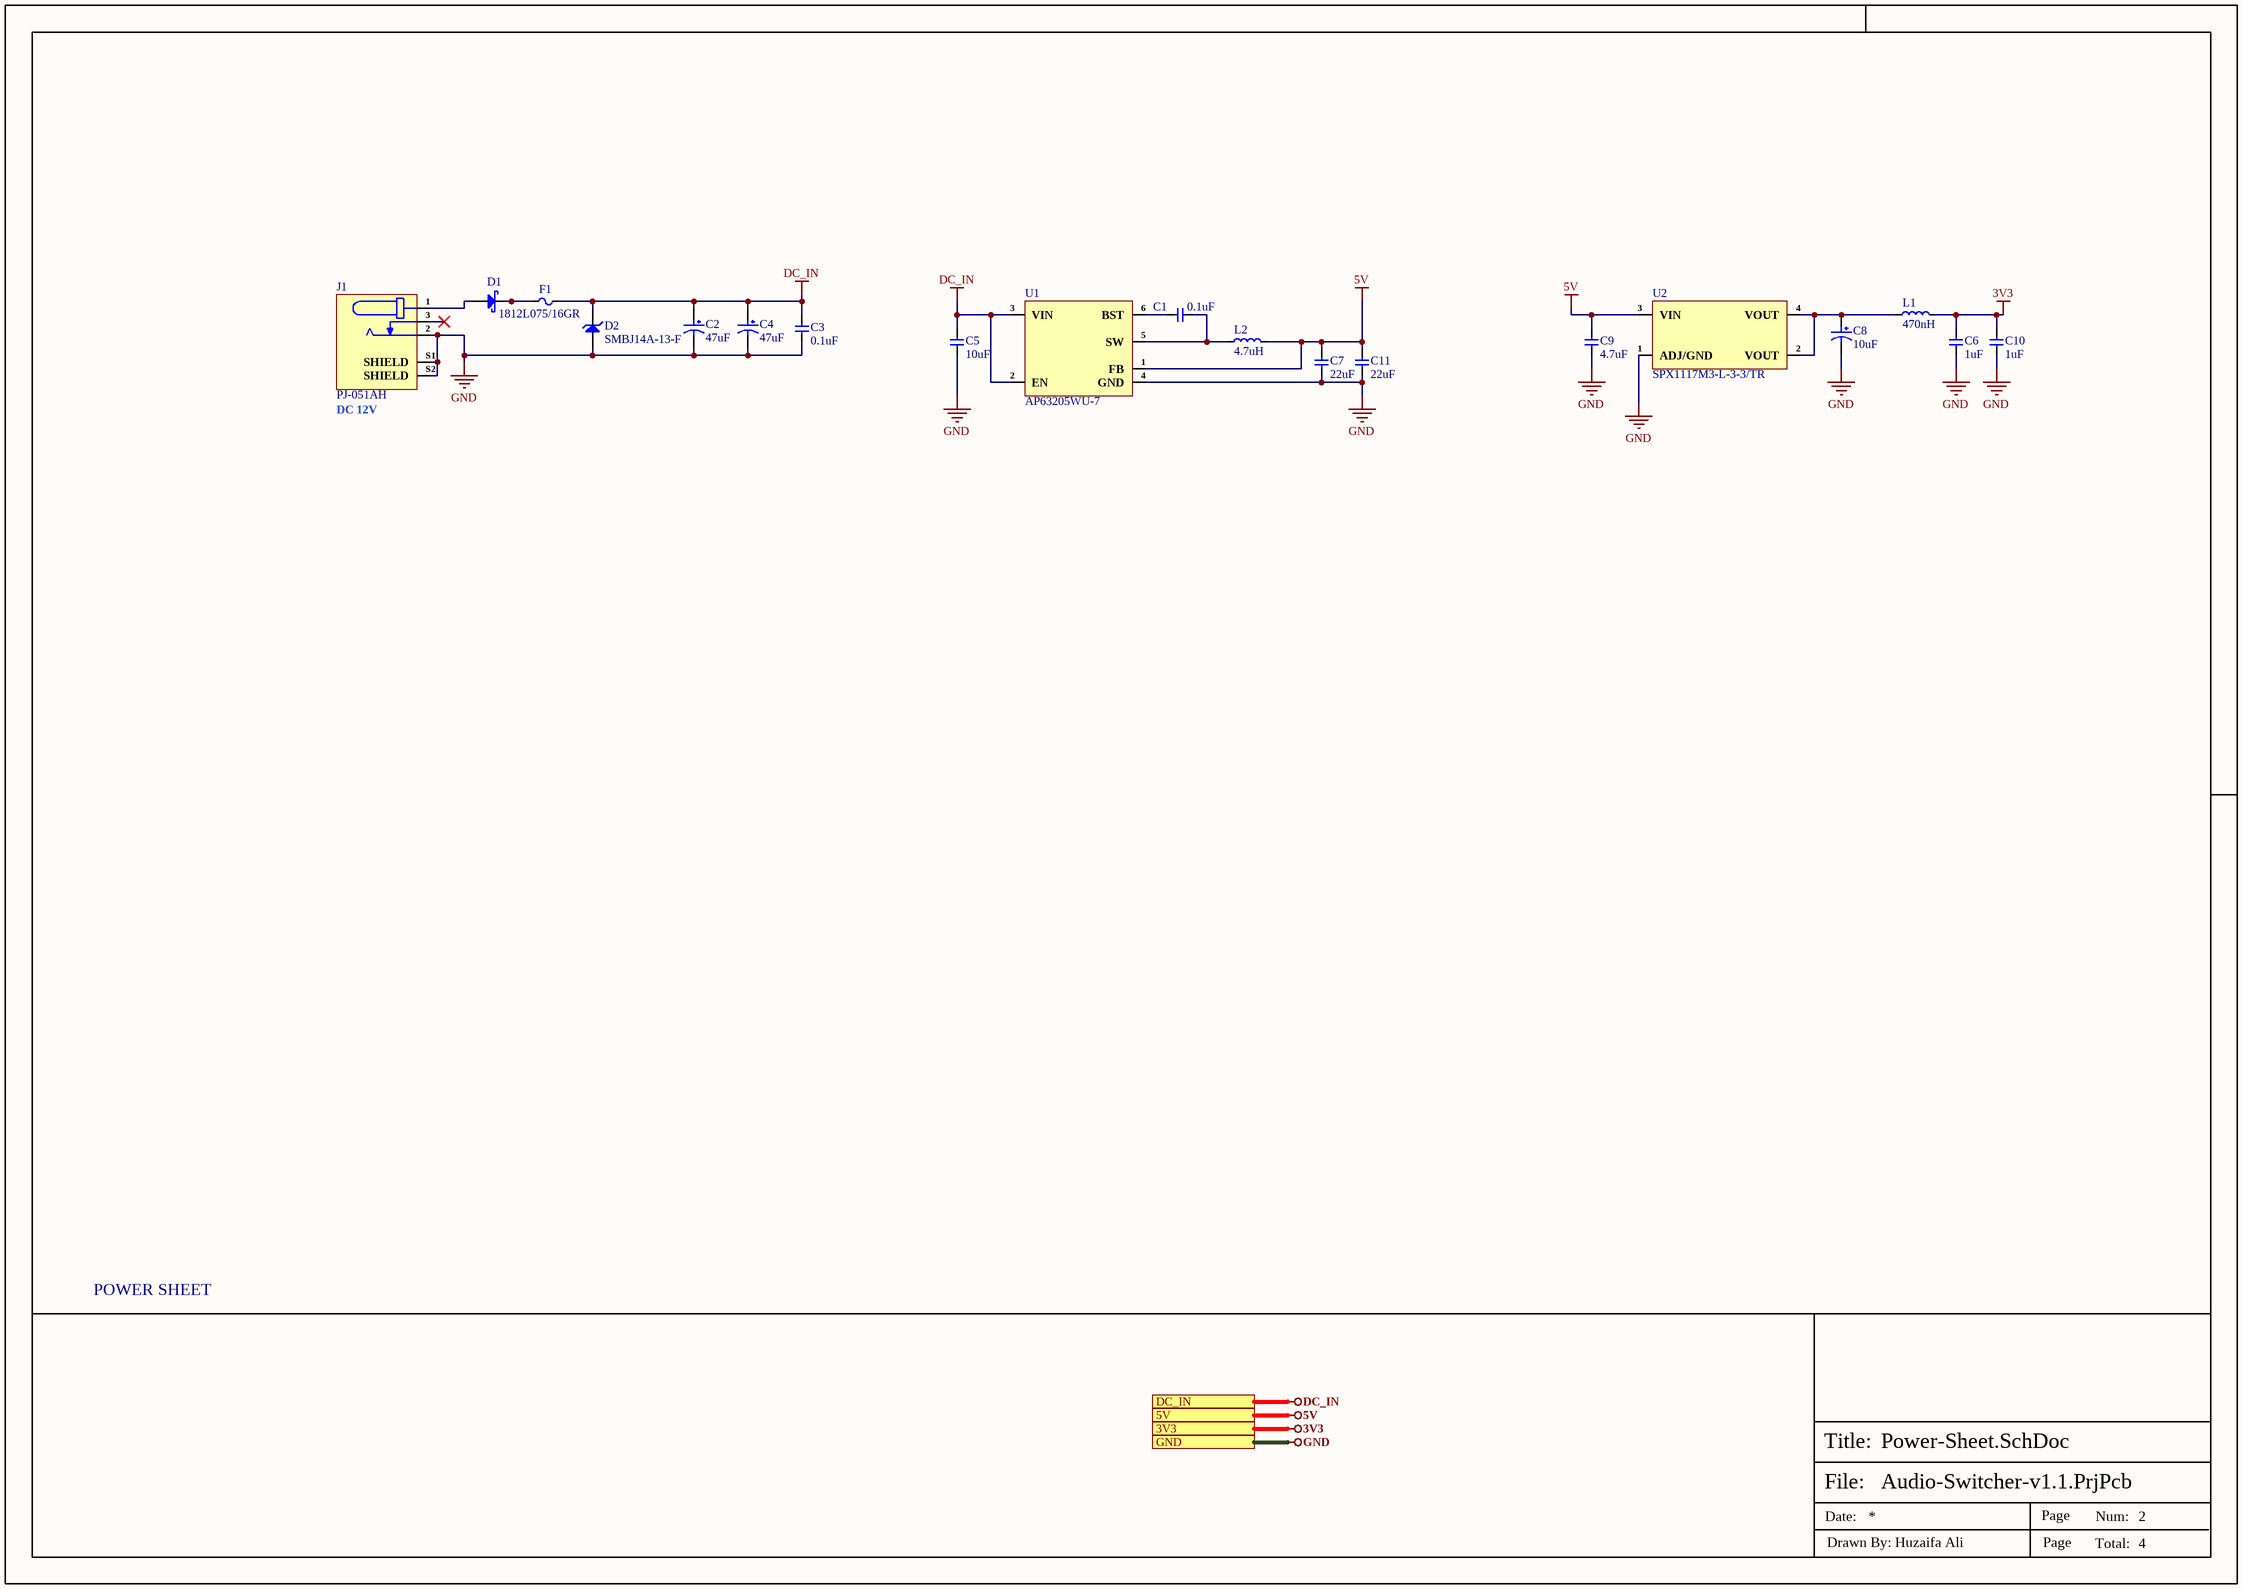
[diagram p2: Power-Sheet.SchDoc]

### Parts
C1  0.1uF  [Cap-0402]
C2  47uF  [RVT1H470M0607]
C3  0.1uF  [Cap-0402]
C4  47uF  [RVT1H470M0607]
C5  10uF  [Cap-1210]
C6  1uF  [Cap-0402]
C7  22uF  [Cap-0402]
C8  10uF  [EDK106M025A9BAA_]
C9  4.7uF  [Cap-0402]
C10  1uF  [Cap-0402]
C11  22uF  [Cap-0402]
D1  SS16  [SMA]  (value not drawn)
D2  SMBJ14A-13-F  [SMB_]
F1  1812L075/16GR  [1812-FUSE]
J1  PJ-051AH  [PJ-051AH]
L1  470nH  [IND-0806]
L2  4.7uH  [YPRH0703-4R7M]
U1  AP63205WU-7  [TSOT-23-6]
U2  SPX1117M3-L-3-3/TR  [SOT- 223]

### Ports
3V3 (see Top_Sheet[1B], Audio-Interface[5D], Controller-Sheet[2D]), 5V (see Top_Sheet[1A], Audio-Interface[5D]), DC_IN (see Top_Sheet[1A]), GND (see Top_Sheet[1B], Audio-Interface[5D], Controller-Sheet[2D])

### Nets
3V3: C6.2 C10.2 L1.2 ; port 3V3
5V: C7.2 C9.2 C11.2 L2.2 U1.1(FB) U2.3(VIN) ; port 5V
DC_IN: C2.1 C3.2 C4.1 C5.2 D2.2(K) F1.2 U1.2(EN) U1.3(VIN) ; port DC_IN
GND: C2.2 C3.1 C4.2 C5.1 C6.1 C7.1 C8.2 C9.1 C10.1 C11.1 D2.1(A) J1.2 J1.S1(SHIELD) J1.S2(SHIELD) U1.4(GND) U2.1(ADJ/GND) ; port GND
NetC1_1: C1.1 L2.1 U1.5(SW)
NetC1_2: C1.2 U1.6(BST)
NetC8_1: C8.1 L1.1 U2.2(VOUT) U2.4(VOUT)
NetD1_1: D1.1(K) F1.1
NetD1_2: D1.2(A) J1.1

Not connected (* = marked no-connect by the designer): J1 3*

### Notes on the sheet
- (near J1) DC 12V
- POWER SHEET
- File:
- Title:
- Date:
- Page
- Num:
- Total:
- Drawn By: Huzaifa Ali

### Library data of the parts
C1 = CL05B104KB54PNC: CAP CER 0.1UF 50V X7R 0402; Manufacturer: Samsung; Supplier 1: Digi-Key; Manufacturer Part Number: CL05B104KB54PNC; Stock 1: 8594; Pricing 1: 1=0.1, 10=0.067, 50=0.0366, 100=0.0299, 500=0.02138, 1000=0.01681, 2500=0.01528, 5000=0.01406 (USD); Supplier Part Number 1: 1276-CL05B104KB54PNCDKR-ND; LCSC Part Number: C307331
C2 C4 = RVT1H470M0607: 47uF 50V 66mA@120Hz ±20% SMD,D6.3xL7.7mm Aluminum Electrolytic Capacitors - SMD ROHS; Manufacturer: ROQANG; Manufacturer Part Number: RVT1H470M0607; Package: SMD,D6.3xL7.7mm; LCSC Part Number: C72523; Item Type: Capacitor; ComponentLink1Description: LCSC; ComponentLink1URL: https://www.lcsc.com/product-detail/Aluminum-Electrolytic-Capacitors-SMD_ROQANG-RVT1H470M0607_C72523.html
C3 = CC0402KRX7R8BB104: as C25 on sheet Controller-Sheet; Supplier 1: Digi-Key; Manufacturer Part Number: CC0402KRX7R8BB104; RoHS: Yes; Category: Ceramic Capacitors; Stock 1: 1841009; Pricing 1: 1=0.10000, 10=0.03100, 50=0.01700, 100=0.01390, 500=0.00990, 1000=0.00777, 2500=0.00707, 5000=0.00650 (USD); Mount: Surface Mount; Case/Package: 0402; Case Code (Imperial): 0402; Case Code (Metric): 1005; Min Operating Temperature: -55°C; Max Operating Temperature: 125°C; Dielectric: X7R; Voltage Rating: 25V; Voltage Rating (DC): 25V; Packaging: Tape and Reel; Termination: SMD/SMT; Resistor Type: Ceramic; Length: 1mm; Width: 0.02inch; Height: 0.5mm; Thickness: 0.022inch; Depth: 0.5mm; Radiation Hardening: No; Lead Free: Lead Free; Halogen Free: Halogen Free; ComponentLink1URL: https://datasheet.ciiva.com/11464/upy-gphc-x7r-6-3v-to-50v-8-11464889.pdf?src-supplier=Avnet; ComponentLink1Description: https://datasheet.ciiva.com/11464/upy-gphc-x7r-6-3v-to-50v-8-11464889.pdf?src-supplier=Avnet; ComponentLink2URL: https://datasheet.ciiva.com/13210/upy-gphc-x7r-6-3v-to-50v-8-12304-13210908.pdf?src-supplier=Mouser; ComponentLink2Description: https://datasheet.ciiva.com/13210/upy-gphc-x7r-6-3v-to-50v-8-12304-13210908.pdf?src-supplier=Mouser; ComponentLink3URL: https://datasheet.ciiva.com/17437/upy-gphc-x7r-6-3v-to-50v-8-17437357.pdf?src-supplier=Avnet+Europe; ComponentLink3Description: https://datasheet.ciiva.com/17437/upy-gphc-x7r-6-3v-to-50v-8-17437357.pdf?src-supplier=Avnet+Europe; Supplier Part Number 1: 311-2077-1-ND; LCSC Part Number: C105883
C5 = GRM32ER71J106KA12L: Multilayer Ceramic Capacitors MLCC - SMD/SMT 1210 10uF 63volts *Derate Voltage/Temp; Manufacturer: Murata; Supplier: Avnet; Supplier Part Number: GRM32ER71J106KA12L; Manufacturer Part Number: GRM32ER71J106KA12L; RoHS: Yes; Category: Ceramic Capacitors; Stock: 55000; Pricing: 1000=0.3451, 2000=0.33698, 4000=0.32886, 6000=0.32074, 8000=0.31262 (USD); ComponentLink1URL: http://www.mouser.com/ds/2/281/c02e-2905.pdf?src-supplier=Mouser; ComponentLink1Description: http://www.mouser.com/ds/2/281/c02e-2905.pdf?src-supplier=Mouser; ComponentLink2URL: http://www.farnell.com/datasheets/2079202.pdf?src-supplier=Farnell; ComponentLink2Description: http://www.farnell.com/datasheets/2079202.pdf?src-supplier=Farnell; ComponentLink3URL: http://search.murata.co.jp/Ceramy/image/img/A01X/G101/ENG/GRM32ER71J106KA12-01.pdf?src-supplier=Digi-Key; ComponentLink3Description: http://search.murata.co.jp/Ceramy/image/img/A01X/G101/ENG/GRM32ER71J106KA12-01.pdf?src-supplier=Digi-Key; ComponentLink4URL: https://datasheet.octopart.com/GRM32ER71J106KA12L-Murata-datasheet-22122223.pdf?src-supplier=Future+Electronics; ComponentLink4Description: https://datasheet.octopart.com/GRM32ER71J106KA12L-Murata-datasheet-22122223.pdf?src-supplier=Future+Electronics; ComponentLink5URL: http://psearch.en.murata.com/capacitor/product/GRM32ER71J106KA12%23.pdf?src-supplier=Avnet; ComponentLink5Description: http://psearch.en.murata.com/capacitor/product/GRM32ER71J106KA12%23.pdf?src-supplier=Avnet; ComponentLink6URL: http://www.farnell.com/datasheets/2079202.pdf?src-supplier=Newark; ComponentLink6Description: http://www.farnell.com/datasheets/2079202.pdf?src-supplier=Newark; ComponentLink7URL: http://www.farnell.com/datasheets/2079202.pdf?src-supplier=Element14; ComponentLink7Description: http://www.farnell.com/datasheets/2079202.pdf?src-supplier=Element14; Package: 1210; LCSC Part Number: C437568; Item Type: Capacitor; ComponentLink8Description: LCSC; ComponentLink8URL: https://www.lcsc.com/product-detail/Multilayer-Ceramic-Capacitors-MLCC-SMD-SMT_Murata-Electronics-GRM32ER71J106KA12L_C437568.html
C6 C10 = CC0402KRX5R7BB105: as C33 on sheet Controller-Sheet; Supplier 1: Digi-Key; Manufacturer Part Number: CC0402KRX5R7BB105; Stock 1: 1405667; Pricing 1: 1=0.36, 10=0.252, 100=0.1512, 500=0.1134, 1000=0.09576, 2500=0.09072, 5000=0.08568 (USD); Mount: Surface Mount; Case/Package: 0402; Weight: 2.3E-05oz; Case Code (Imperial): 0402; Case Code (Metric): 1005; Min Operating Temperature: -55°C; Max Operating Temperature: 85°C; Capacitance: 1uF; Dielectric: X5R; Packaging: Tape and Reel; Voltage Rating (DC): 16V; Voltage Rating: 16V; Termination: SMD/SMT; Composition: Ceramic; Length: 1mm; Height: 0.5mm; Width: 0.02inch; Thickness: 0.022inch; Depth: 0.5mm; Radiation Hardening: No; Lead Free: Lead Free; Halogen Free: Halogen Free; ComponentLink1URL: http://www.yageo.com/documents/recent/UPY-GPHC_X5R_4V-to-50V_12.pdf?src-supplier=Avnet+Europe; ComponentLink1Description: http://www.yageo.com/documents/recent/UPY-GPHC_X5R_4V-to-50V_12.pdf?src-supplier=Avnet+Europe; Supplier Part Number 1: 311-1691-6-ND; LCSC Part Number: C325464
C7 C11 = GRM158R61A226ME15D: CAP CER 22UF 10V X5R 0402; Item Type: Capacitor; Material: 4241ConductorMaterial; Dielectric: 1537DielectricType; Tolerance: 20%; Supplier: Digi-Key; Supplier Part Number: 490-GRM158R61A226ME15DCT-ND; RoHS: Yes; Category: Ceramic Capacitors; Stock: 26634; Pricing: 1=0.45, 10=0.299, 50=0.2202, 100=0.1794, 500=0.1416, 1000=0.11957, 2500=0.11328 (USD); Case/Package: 343Case; Min Operating Temperature: -55°C; Max Operating Temperature: 85°C; Value: 22uF; Voltage Rating: 10V; Voltage Rating (DC): 10V; Length: 1mm; Width: 500um; Height: 800um; Thickness: 800um
C8 = EDK106M025A9BAA: CAP ALUM 10UF 20% 25V SMD; Manufacturer: KEMET; Dielectric Material: Aluminium; Ripple Current: 10mA; Life (Hours): 2000Hour; Leakage Current: 3uA; Dissipation Factor: 0.14%; Polarity: Polar; Lead Length: 1.8mm; Supplier 1: Digi-Key; Manufacturer Part Number: EDK106M025A9BAA; Stock 1: 9371; Pricing 1: 1=0.33, 10=0.225, 50=0.15, 100=0.1275, 500=0.08998, 1000=0.07873 (USD); Mount: Surface Mount,PCB; Case/Package: Radial; Min Operating Temperature: -40°C; Max Operating Temperature: 85°C; Package Quantity: 2000; Capacitance: 10uF; Voltage Rating: 25V; Tolerance: 20%; Packaging: Tape and Reel; Voltage Rating (DC): 25V; Termination: SMD/SMT; Series: EDK; Voltage: 25V; Diameter: 4mm; Length: 5.4mm; Height: 5.4mm; Height - Seated (Max): 0.217inch; Lead Pitch: 1mm; RoHS Compliant: Yes; REACH SVHC: No SVHC; ComponentLink1URL: https://api.kemet.com/component-edge/download/datasheet/EDK106M025A9BAA.pdf?src-supplier=Digi-Key; ComponentLink1Description: https://api.kemet.com/component-edge/download/datasheet/EDK106M025A9BAA.pdf?src-supplier=Digi-Key; ComponentLink2URL: https://www.alliedelec.com/m/d/48a492d9821943f3a399faec33a8c847.pdf?src-supplier=Allied+Electronics; ComponentLink2Description: https://www.alliedelec.com/m/d/48a492d9821943f3a399faec33a8c847.pdf?src-supplier=Allied+Electronics; ComponentLink3URL: http://www.mouser.com/ds/2/212/KEM_A4001_EDK-535350.pdf?src-supplier=Mouser; ComponentLink3Description: http://www.mouser.com/ds/2/212/KEM_A4001_EDK-535350.pdf?src-supplier=Mouser; Supplier Part Number 1: 399-6048-1-ND; LCSC Part Number: C1984940
C9 = CC0402KRX5R6BB475: CAP CER 4.7UF 10V X5R 0402; Manufacturer: Yageo; Tolerance: 10%; Supplier 1: Farnell; Manufacturer Part Number: CC0402KRX5R6BB475; RoHS: Yes; Category: Ceramic Capacitors; Stock 1: 20000; Pricing 1: 10000=0.02310, 50000=0.02100 (GBP); Mount: Surface Mount; Case/Package: 0402; Case Code (Imperial): 0402; Case Code (Metric): 1005; Min Operating Temperature: -55°C; Max Operating Temperature: 85°C; Packaging: Cut Tape; Capacitance: 4.7uF; Voltage Rating: 10V; RoHS Compliant: Yes; ComponentLink1URL: http://www.yageo.com/documents/recent/UPY-GPHC_X5R_4V-to-50V_25.pdf?src-supplier=Digi-Key; ComponentLink1Description: http://www.yageo.com/documents/recent/UPY-GPHC_X5R_4V-to-50V_25.pdf?src-supplier=Digi-Key; Supplier Part Number 1: 3871698; LCSC Part Number: C326586
D1 = SS16: 60V 700mV@1A 1A SMA(DO-214AC) Schottky Barrier Diodes (SBD) ROHS; Manufacturer: MDD; Item Type: Schottky Diode; Manufacturer Part Number: SS16; Package: SMA(DO-214AC); LCSC Part Number: C2481; ComponentLink1Description: LCSC; ComponentLink1URL: https://www.lcsc.com/product-detail/Schottky-Barrier-Diodes-SBD_MDD-Microdiode-Electronics-SS16_C2481.html
D2 = SMBJ14A-13-F: TVS DIODE 14VWM 23.2VC SMB; Manufacturer: Diodes; Direction: Unidirectional; Reverse Breakdown Voltage: 15.6V; Max Surge Current: 25.8A; Reverse Standoff Voltage: 14V; Clamping Voltage: 23.2V; Max Power Dissipation: 600W; Number of Elements: 1; Test Current: 1mA; Max Reverse Leakage Current: 5uA; Max Breakdown Voltage: 17.9V; Forward Voltage: 5V; Value: 1nF; Number of Channels: 1NUMBER; Supplier: Digikey; Supplier Part Number: SMBJ14A-FDICT-ND; Manufacturer Part Number: SMBJ14A-13-F; RoHS: Yes; Category: TVS Diodes; Stock: 21112; Pricing: 1=0.43, 10=0.305, 100=0.1538, 500=0.13628, 1000=0.10605 (USD); Mounting Technology: Surface Mount; Case/Package: SMB; Pins: 2; Min Operating Temperature: -55°C; Max Operating Temperature: 150°C; Packaging: Tape and Reel; Package Quantity: 1; Polarity: Unidirectional; Termination: SMD/SMT; Working Voltage: 14V; Breakdown Voltage: 15.6V; Peak Pulse Current: 25.8A; Peak Pulse Power: 600W; Min Breakdown Voltage: 15.6V; Power Dissipation: 600W; Leakage Current: 5uA; Voltage Rating (DC): 14V; Max Output current: 25.8A; Series: SMBJ; Clamping Voltage-Max: 23.2V; Length: 4.57mm; Width: 3.9mm; Height: 2.62mm; Radiation Hardening: No; Lead Free: Lead Free; RoHS Compliant: Yes; ComponentLink1URL: https://datasheet.ciiva.com/15143/getdatasheetpartid-91658-15143394.pdf?src-supplier=Verical; ComponentLink1Description: https://datasheet.ciiva.com/15143/getdatasheetpartid-91658-15143394.pdf?src-supplier=Verical; ComponentLink2URL: https://datasheet.ciiva.com/16487/ds19002-16487576.pdf?src-supplier=Future+Electronics; ComponentLink2Description: https://datasheet.ciiva.com/16487/ds19002-16487576.pdf?src-supplier=Future+Electronics; Item Type: Diode
F1 = 1812L075/16GR: 16V 750mA 1.5A 1812 Resettable Fuses ROHS; Manufacturer: LUTE; Manufacturer Part Number: 1812L075/16GR; Package: 1812; LCSC Part Number: C19078721; Item Type: Fuses; ComponentLink1Description: LCSC; ComponentLink1URL: https://www.lcsc.com/product-detail/Resettable-Fuses_LUTE-1812L075-16GR_C19078721.html
J1 = PJ-051AH: CONN PWR JACK 2X5.5MM SOLDER; Manufacturer: CUI Devices; Item Type: Power Connectors; Supplier: Digikey; LCSC Part Number: C22359773; Manufacturer Part Number: PJ-051AH; RoHS: Yes; Stock: 42904; Pricing: 1=1.1, 10=0.839, 25=0.754, 50=0.6964, 100=0.6438, 250=0.58156, 500=0.53948, 1000=0.50126, 2500=0.45618 (USD); ComponentLink1URL: https://www.cuidevices.com/product/resource/digikeypdf/pj-051ah.pdf?src-supplier=Digikey; ComponentLink1Description: https://www.cuidevices.com/product/resource/digikeypdf/pj-051ah.pdf?src-supplier=Digikey; ComponentLink2URL: https://datasheet.octopart.com/PJ-051AH-CUI-Devices-datasheet-137760691.pdf?src-supplier=Future+Electronics; ComponentLink2Description: https://datasheet.octopart.com/PJ-051AH-CUI-Devices-datasheet-137760691.pdf?src-supplier=Future+Electronics; ComponentLink3URL: https://datasheet.octopart.com/PJ-051AH-CUI-Devices-datasheet-141000361.pdf?src-supplier=Master+Electronics; ComponentLink3Description: https://datasheet.octopart.com/PJ-051AH-CUI-Devices-datasheet-141000361.pdf?src-supplier=Master+Electronics
L1 = 1286AS-H-R47M=P2: FIXED IND 470NH 3.4A 52 MOHM SMD; Manufacturer: Murata; Core Material: Ferrite; Shielding: Shielded; DC Resistance (DCR): 52mR; Test Frequency: 1MHz; Max DC Current: 3.8A; Tolerance: 20%; Item Type: Inductor; Supplier: Digi-Key; Supplier Part Number: 490-10606-1-ND; Manufacturer Part Number: 1286AS-H-R47M=P2; RoHS: Yes; Category: Fixed Inductors; Stock: 12493; Pricing: 1=0.39, 10=0.348, 25=0.3048, 50=0.2612, 100=0.2394, 250=0.21764, 500=0.2046, 1000=0.15671 (USD); Mounting Technology: Surface Mount; Case/Package: 0806; Case Code (Metric): 2016; Case Code (Imperial): 0806; Min Operating Temperature: -40°C; Max Operating Temperature: 85°C; Value: 470nH; Packaging: Cut Tape; Current Rating: 3.4A; Series: DFE201612C; Length: 0.079inch; Width: 0.063inch; Height - Seated (Max): 0.047inch; Depth: 1.6mm; RoHS Compliant: Yes; ComponentLink1URL: http://www.farnell.com/datasheets/2021974.pdf?src-supplier=Farnell; ComponentLink1Description: http://www.farnell.com/datasheets/2021974.pdf?src-supplier=Farnell; ComponentLink2URL: http://www.toko.co.jp/products/pdf/inductors/dfe201612c.pdf?src-supplier=Avnet; ComponentLink2Description: http://www.toko.co.jp/products/pdf/inductors/dfe201612c.pdf?src-supplier=Avnet; ComponentLink3URL: http://search.murata.co.jp/Ceramy/image/img/P02/J(E)TE243A-0010_DFE201612C_reference.pdf?src-supplier=Digi-Key; ComponentLink3Description: http://search.murata.co.jp/Ceramy/image/img/P02/J(E)TE243A-0010_DFE201612C_reference.pdf?src-supplier=Digi-Key; ComponentLink4URL: http://www.toko.co.jp/products/pdf/inductors/dfe201612c.pdf?src-supplier=Digi-Key; ComponentLink4Description: http://www.toko.co.jp/products/pdf/inductors/dfe201612c.pdf?src-supplier=Digi-Key; LCSC Part Number: C160957
L2 = YPRH0703-4R7M: 2.26A 4.7uH ±20% SMD,7.3x7.3mm Power Inductors ROHS; Manufacturer: YJYCOIN; Manufacturer Part Number: YPRH0703-4R7M; Package: SMD,7.3x7.3mm; LCSC Part Number: C338836; Item type: Inductor; ComponentLink1Description: LCSC; ComponentLink1URL: https://www.lcsc.com/product-detail/Power-Inductors_YJYCOIN-YPRH0703-4R7M_C338836.html
U1 = AP63205WU-7: IC REG BUCK 5V 2A TSOT26; Manufacturer: Diodes; Supplier 1: Digi-Key; Manufacturer Part Number: AP63205WU-7; RoHS: Yes; Category: Voltage Regulators - Switching; Stock 1: 88525; Pricing 1: 1=0.88, 10=0.776, 25=0.7292, 100=0.5952, 250=0.55284, 500=0.4705, 1000=0.3764 (USD); Supplier Part Number 1: AP63205WU-7DICT-ND; LCSC Part Number: C2071056; Item Type: IC
U2 = SPX1117M3-L-3-3/TR: IC REG LINEAR 3.3V 800MA SOT223; Manufacturer: MaxLinear; Number of Outputs: 1NUMBER; Max Supply Voltage: 20V; Nominal Supply Current: 5mA; Supplier: Digikey; LCSC Part Number: C6862; Manufacturer Part Number: SPX1117M3-L-3-3/TR; RoHS: Yes; Item Type: IC; Stock: 42701; Pricing: 1=0.68, 10=0.422, 25=0.3516, 100=0.2712, 250=0.2316, 500=0.20734, 1000=0.18707 (USD); Output Voltage: 3.3V; Number of Channels: 1NUMBER; Height: 1.8mm; ComponentLink1URL: https://datasheet.octopart.com/SPX1117M3-L-3-3-TR-MaxLinear-datasheet-11629451.pdf?src-supplier=Element14; ComponentLink1Description: https://datasheet.octopart.com/SPX1117M3-L-3-3-TR-MaxLinear-datasheet-11629451.pdf?src-supplier=Element14; ComponentLink2URL: https://www.exar.com/content/document.ashx?id=694&src-supplier=Digikey; ComponentLink2Description: https://www.exar.com/content/document.ashx?id=694&src-supplier=Digikey; ComponentLink3URL: https://datasheet.octopart.com/SPX1117M3-L-3-3-TR-MaxLinear-datasheet-133511130.pdf?src-supplier=TME; ComponentLink3Description: https://datasheet.octopart.com/SPX1117M3-L-3-3-TR-MaxLinear-datasheet-133511130.pdf?src-supplier=TME